# Altium schematic sheet PERIPHERAL_SHEET.SchDoc
size A; SheetNumber: 3; SheetTotal: 9
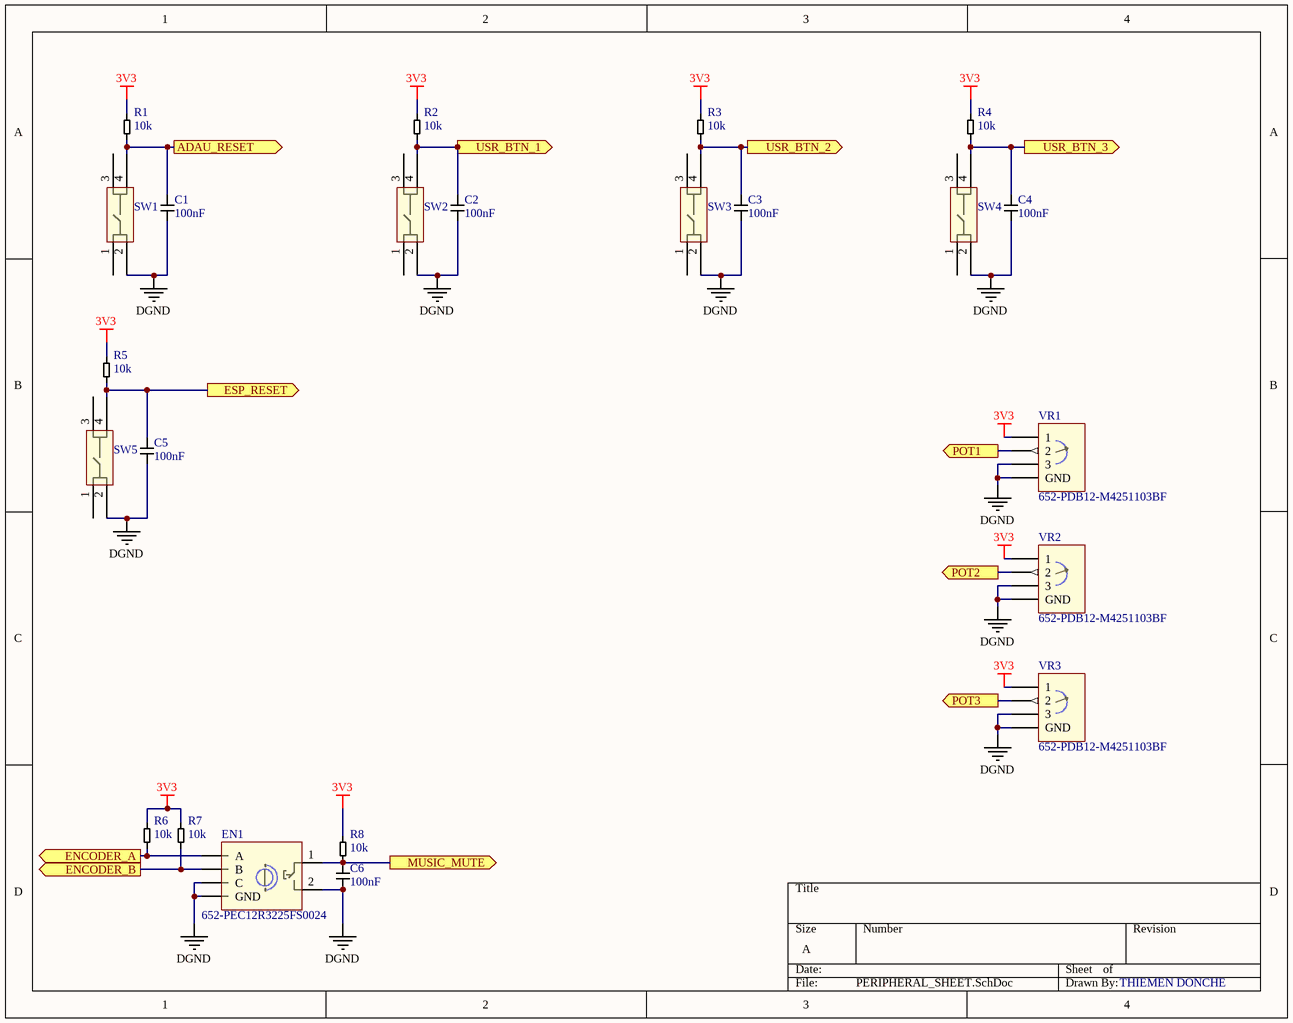
[diagram p0: PERIPHERAL_SHEET.SchDoc]

## Parts
C1  100nF  [0603_SMD_CAP]
C2  100nF  [0603_SMD_CAP]
C3  100nF  [0603_SMD_CAP]
C4  100nF  [0603_SMD_CAP]
C5  100nF  [0603_SMD_CAP]
C6  100nF  [0603_SMD_CAP]
EN1  Supplier Part Number 1: 652-PEC12R3225FS0024  [ROTARY_ENCODER]  (hidden comment: rotary encoder)
R1  10k  [0603_SMD_PACKAGE]
R2  10k  [0603_SMD_PACKAGE]
R3  10k  [0603_SMD_PACKAGE]
R4  10k  [0603_SMD_PACKAGE]
R5  10k  [0603_SMD_PACKAGE]
R6  10k  [0603_SMD_PACKAGE]
R7  10k  [0603_SMD_PACKAGE]
R8  10k  [0603_SMD_PACKAGE]
SW1  4PIN-TACTILE-SWITCH  [4pin-tactile-switch]  (value not drawn)
SW2  4PIN-TACTILE-SWITCH  [4pin-tactile-switch]  (value not drawn)
SW3  4PIN-TACTILE-SWITCH  [4pin-tactile-switch]  (value not drawn)
SW4  4PIN-TACTILE-SWITCH  [4pin-tactile-switch]  (value not drawn)
SW5  4PIN-TACTILE-SWITCH  [4pin-tactile-switch]  (value not drawn)
VR1  Supplier Part Number 1: 652-PDB12-M4251103BF  [POTENTIOMETER]  (hidden comment: potentiometer)
VR2  Supplier Part Number 1: 652-PDB12-M4251103BF  [POTENTIOMETER]  (hidden comment: potentiometer)
VR3  Supplier Part Number 1: 652-PDB12-M4251103BF  [POTENTIOMETER]  (hidden comment: potentiometer)

## Ports
ADAU_RESET (out, see TOP_SHEET[4B], ADAU_POWER[3C]), ENCODER_A (out, see TOP_SHEET[4B], ESP_SHEET[1B]), ENCODER_B (out, see TOP_SHEET[4B], ESP_SHEET[1B]), ESP_RESET (out, see TOP_SHEET[4B], ESP_SHEET[2A]), MUSIC_MUTE (out, see TOP_SHEET[4A], ADAU_PERIPHERALS[3B]), POT1 (out, see TOP_SHEET[4A], ADAU_PERIPHERALS[1C]), POT2 (out, see TOP_SHEET[4A], ADAU_PERIPHERALS[1C]), POT3 (out, see TOP_SHEET[4A], ADAU_PERIPHERALS[1C]), USR_BTN_1 (out, see TOP_SHEET[4A], ADAU_PERIPHERALS[1B]), USR_BTN_2 (out, see TOP_SHEET[4A], ADAU_PERIPHERALS[1B]), USR_BTN_3 (out, see TOP_SHEET[4A], ADAU_PERIPHERALS[1B])

## Nets
3V3: R1.2 R2.2 R3.2 R4.2 R5.2 R6.2 R7.2 R8.2 VR1.1 VR2.1 VR3.1
DGND: C1.1 C2.1 C3.1 C4.1 C5.1 C6.1 EN1.2 EN1.5(C) EN1.6(GND) SW1.2 SW2.2 SW3.2 SW4.2 SW5.2 VR1.3 VR1.4(GND) VR2.3 VR2.4(GND) VR3.3 VR3.4(GND)
ADAU_RESET: C1.2 R1.1 SW1.4 ; port ADAU_RESET
ENCODER_A: EN1.3(A) R6.1 ; port ENCODER_A
ENCODER_B: EN1.4(B) R7.1 ; port ENCODER_B
ESP_RESET: C5.2 R5.1 SW5.4 ; port ESP_RESET
MUSIC_MUTE: C6.2 EN1.1 R8.1 ; port MUSIC_MUTE
POT1: VR1.2 ; port POT1
POT2: VR2.2 ; port POT2
POT3: VR3.2 ; port POT3
USR_BTN_1: C2.2 R2.1 SW2.4 ; port USR_BTN_1
USR_BTN_2: C3.2 R3.1 SW3.4 ; port USR_BTN_2
USR_BTN_3: C4.2 R4.1 SW4.4 ; port USR_BTN_3

Not connected (* = marked no-connect by the designer): SW1 1 3; SW2 1 3; SW3 1 3; SW4 1 3; SW5 1 3

## Notes on the sheet
- THIEMEN DONCHE

## Library data of the parts
C1-C6 = ceramic capacator: type: *
R1-R8 = resistor: type: *
EN1 = rotary encoder: Supplier 1: Mouser
VR1-VR3 = potentiometer: Supplier 1: Mouser